# Altium schematic sheet Processing_Section.SchDoc
size A4; DocumentNumber: 3; SheetNumber: 3; SheetTotal: 5
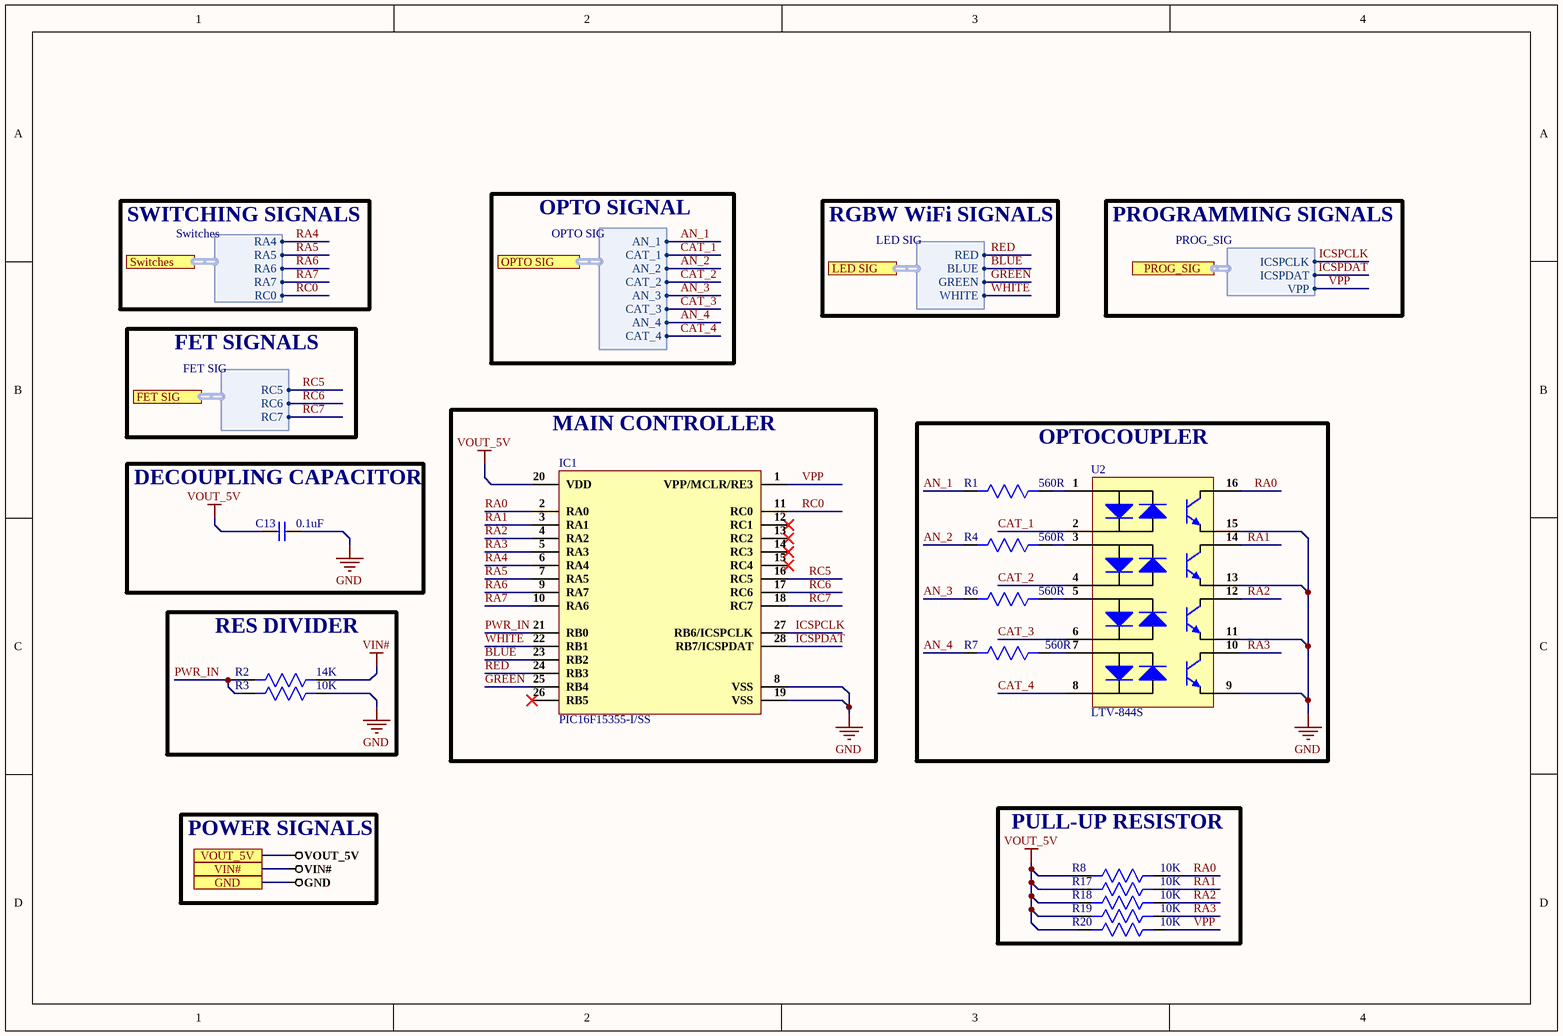
[diagram p0: Processing_Section.SchDoc]

## Parts
C13  0.1uF  [CAP 0201]
IC1  PIC16F15355-I/SS  [PIC16F15355-I/SS]
R1  560R  [RES 1210]
R2  14K  [Res0603]
R3  10K  [RES 0805]
R4  560R  [RES 1210]
R6  560R  [RES 1210]
R7  560R  [RES 1210]
R8  10K  [RES 0805]
R17  10K  [RES 0805]
R18  10K  [RES 0805]
R19  10K  [RES 0805]
R20  10K  [RES 0805]
U2  LTV-844S  [LTV-844S]

## Blocks framed on the sheet
MAIN CONTROLLER: IC1
OPTOCOUPLER: R1 R4 R6 R7 U2
DECOUPLING CAPACITOR: C13
RES DIVIDER: R2 R3
PULL-UP RESISTOR: R8 R17-R20

## Ports
FET SIG (harness FET SIG), GND, LED SIG (harness LED SIG), OPTO SIG (harness OPTO SIG), PROG_SIG (harness PROG_SIG), Switches (harness Switches), VIN#, VOUT_5V

## Harnesses
LED SIG: RED, BLUE, GREEN, WHITE
PROG_SIG: ICSPCLK, ICSPDAT, VPP
OPTO SIG: AN_1, CAT_1, AN_2, AN_3, AN_4, CAT_2, CAT_3, CAT_4
Switches: RA4, RA5, RA6, RA7, RC0
FET SIG: RC5, RC6, RC7

## Nets
GND: C13.2 IC1.8(VSS) IC1.19(VSS) R3.2 U2.9(E) U2.11(E) U2.13(E) U2.15(E) ; port GND
VIN#: R2.2 ; port VIN#
VOUT_5V: C13.1 IC1.20(VDD) R8.1 R17.1 R18.1 R19.1 R20.1 ; port VOUT_5V
AN_1: R1.1 ; port OPTO SIG.AN_1
AN_2: R4.1 ; port OPTO SIG.AN_2
AN_3: R6.1 ; port OPTO SIG.AN_3
AN_4: R7.1 ; port OPTO SIG.AN_4
BLUE: IC1.23(RB2) ; port LED SIG.BLUE
CAT_1: U2.2(K,A) ; port OPTO SIG.CAT_1
CAT_2: U2.4(K,A) ; port OPTO SIG.CAT_2
CAT_3: U2.6(K,A) ; port OPTO SIG.CAT_3
CAT_4: U2.8(K,A) ; port OPTO SIG.CAT_4
GREEN: IC1.25(RB4) ; port LED SIG.GREEN
ICSPCLK: IC1.27(RB6/ICSPCLK) ; port PROG_SIG.ICSPCLK
ICSPDAT: IC1.28(RB7/ICSPDAT) ; port PROG_SIG.ICSPDAT
PWR_IN: IC1.21(RB0) R2.1 R3.1
RA0: IC1.2(RA0) R8.2 U2.16(C)
RA1: IC1.3(RA1) R17.2 U2.14(C)
RA2: IC1.4(RA2) R18.2 U2.12(C)
RA3: IC1.5(RA3) R19.2 U2.10(C)
RA4: IC1.6(RA4) ; port Switches.RA4
RA5: IC1.7(RA5) ; port Switches.RA5
RA6: IC1.9(RA7) ; port Switches.RA6
RA7: IC1.10(RA6) ; port Switches.RA7
RC0: IC1.11(RC0) ; port Switches.RC0
RC5: IC1.16(RC5) ; port FET SIG.RC5
RC6: IC1.17(RC6) ; port FET SIG.RC6
RC7: IC1.18(RC7) ; port FET SIG.RC7
RED: IC1.24(RB3) ; port LED SIG.RED
VPP: IC1.1(VPP/MCLR/RE3) R20.2 ; port PROG_SIG.VPP
WHITE: IC1.22(RB1) ; port LED SIG.WHITE
NetR1_2: R1.2 U2.1(A,K)
NetR4_2: R4.2 U2.3(A,K)
NetR6_2: R6.2 U2.5(A,K)
NetR7_2: R7.2 U2.7(A,K)

Not connected (* = marked no-connect by the designer): IC1 12(RC1)* 13(RC2)* 14(RC3)* 15(RC4)* 26(RB5)*

## Notes on the sheet
- SWITCHING SIGNALS
- OPTO SIGNAL
- RGBW WiFi SIGNALS
- PROGRAMMING SIGNALS
- FET SIGNALS
- POWER SIGNALS

## Library data of the parts
C13 = GRM033R61E104KE14D: CAP CER 0.1UF 25V X5R 0201; Manufacturer: Murata; Capacitance: 100nF; Tolerance: 10%; Supplier 1: Mouser; Manufacturer Part Number: GRM033R61E104KE14D; RoHS: Yes; Category: Ceramic Capacitors; Stock 1: 19728; Pricing 1: 1=0.12000, 10=0.05600, 50=0.05600, 100=0.02500, 1000=0.01400, 10000=0.01100 (USD); Mount: Surface Mount; Case/Package: 0201; Case Code (Metric): 0603; Case Code (Imperial): 0201; Weight: 1.2E-05oz; Min Operating Temperature: -55°C; Max Operating Temperature: 85°C; Packaging: Tape and Reel; Voltage Rating: 25V; Dielectric: X5R; Termination: SMD/SMT; Resistor Type: Ceramic; Voltage Rating (DC): 25V; Package Quantity: 15000; Length: 0.024inch; Width: 0.012inch; Height: 0.3mm; Thickness: 0.013inch; Lead Free: Lead Free; RoHS Compliant: Yes; ComponentLink1URL: http://www.farnell.com/datasheets/2867843.pdf?src-supplier=Farnell; ComponentLink1Description: http://www.farnell.com/datasheets/2867843.pdf?src-supplier=Farnell; ComponentLink2URL: http://www.mouser.com/ds/2/281/c02e-2905.pdf?src-supplier=Mouser; ComponentLink2Description: http://www.mouser.com/ds/2/281/c02e-2905.pdf?src-supplier=Mouser; ComponentLink3URL: http://search.murata.co.jp/Ceramy/image/img/A01X/G101/ENG/GRM033R61E104KE14-01.pdf?src-supplier=Digi-Key; ComponentLink3Description: http://search.murata.co.jp/Ceramy/image/img/A01X/G101/ENG/GRM033R61E104KE14-01.pdf?src-supplier=Digi-Key; ComponentLink4URL: http://www.farnell.com/datasheets/2867843.pdf?src-supplier=Newark; ComponentLink4Description: http://www.farnell.com/datasheets/2867843.pdf?src-supplier=Newark; Supplier Part Number 1: 81-GRM033R61E104KE4D
IC1 = PIC16F15355-I/SS: IC MCU 8BIT 14KB FLASH 28SSOP; Manufacturer: Microchip; Interface: I2C,SPI,UART,USART; Peripherals: Brown-out Detect/Reset,POR,PWM,WDT; Core Architecture: PIC; Frequency: 32MHz; Number of I/Os: 25; Oscillator Type: Internal; Supplier 1: Digi-Key; Manufacturer Part Number: PIC16F15355-I/SS; RoHS: Yes; Category: Microcontrollers; Stock 1: 36; Pricing 1: 1=1.39000, 25=1.27640, 100=1.15500 (USD); Case/Package: SSOP; Min Operating Temperature: -40°C; Max Operating Temperature: 85°C; Memory Type: FLASH; Packaging: Rail/Tube; Memory Size: 14KB; RoHS Compliant: Yes; ComponentLink1URL: http://www.microchip.com/mymicrochip/filehandler.aspx?ddocname=en585524&src-supplier=Digi-Key; ComponentLink1Description: http://www.microchip.com/mymicrochip/filehandler.aspx?ddocname=en585524&src-supplier=Digi-Key; Supplier Part Number 1: PIC16F15355-I/SS-ND
R1 R4 R6 R7 = RC1210FR-07560RL: RES 560 OHM 1% 1/2W 1210; Manufacturer: Yageo; Power Rating: 500mW; Voltage Rating: 200V; Temperature Coefficient: 100ppm/°C; Supplier 1: Digi-Key; Manufacturer Part Number: RC1210FR-07560RL; RoHS: Yes; Category: Chip SMD Resistors; Pricing 1: 1=0.17000, 10=0.14900, 100=0.05740, 1000=0.02525, 2500=0.02181 (USD); Case/Package: 1210; Case Code (Imperial): 1210; Case Code (Metric): 3225; Size Code: 1210; Min Operating Temperature: -55°C; Max Operating Temperature: 155°C; Tolerance: 1%; Packaging: Tape and Reel; Resistance: 560R; Resistor Type: Thick Film; Termination: SMD/SMT; Number of Terminations: 2; Max Power Dissipation: 500mW; Features: Moisture Resistant; Series: RC; Construction: Rectangular; Length: 3.1mm; Width: 2.6mm; Height: 0.024inch; Depth: 2.6mm; Military Standard: Not; Lead Free: Lead Free; RoHS Compliant: Yes; ComponentLink1URL: https://datasheet.ciiva.com/12575/pyu-rc1210-51-rohs-l-4-12575621.pdf?src-supplier=Mouser; ComponentLink1Description: https://datasheet.ciiva.com/12575/pyu-rc1210-51-rohs-l-4-12575621.pdf?src-supplier=Mouser; Supplier Part Number 1: 13-RC1210FR-07560RLCT-ND
R2 = RT0603BRE0714KL: RES SMD 0603 14kOhm 0.1% Paper T/R; Manufacturer: Yageo; Resistance: 14kR; Power Rating: 100mW; Voltage Rating (DC): 50V; Temperature Coefficient: 50ppm/°C; Supplier 1: Digi-Key; Manufacturer Part Number: RT0603BRE0714KL; RoHS: Yes; Category: Chip SMD Resistors; Pricing 1: 5000=0.04543 (USD); Case/Package: 0603; Min Operating Temperature: -55°C; Max Operating Temperature: 155°C; Tolerance: 0.1%; Packaging: Tape and Reel; Resistor Type: Thin Film; Series: RT; Max Power Dissipation: 100mW; Number of Terminations: 2; Construction: Rectangular; Length: 1.6mm; Width: 800um; Depth: 0.8mm; Military Standard: Not; Lead Free: Lead Free; RoHS Compliant: Yes; ComponentLink1URL: http://components.arrow.com/part/dataview/0323_03292491?src-supplier=Arrow+Europe; ComponentLink1Description: http://components.arrow.com/part/dataview/0323_03292491?src-supplier=Arrow+Europe; ComponentLink2URL: http://www.yageo.com/documents/recent/PYu-RT_1-to-0.01_RoHS_L_9.pdf?src-supplier=Digi-Key; ComponentLink2Description: http://www.yageo.com/documents/recent/PYu-RT_1-to-0.01_RoHS_L_9.pdf?src-supplier=Digi-Key; Supplier Part Number 1: RT0603BRE0714KL-ND
R3 R8 R17-R20 = 0805W8F1002T5E: ±1% 1/8W Thick Film Resistors 150V ±100ppm/℃ -55℃~+155℃ 10kΩ 0805 Chip Resistor - Surface Mount ROHS; Manufacturer: UNI-ROYAL; Manufacturer Part No: 0805W8F1002T5E; Package: 0805; Value: 10kΩ
U2 = LTV-844S: OPTOISOLTR 5KV 4CH TRANS 16-SMD; Manufacturer: Vishay Lite-On; Forward Voltage: 1.4V; Number of Channels: 4; Collector Emitter Voltage (VCEO): 35V; Rise Time: 18000ns; Forward Current: 50mA; Collector Emitter Saturation Voltage: 200mV; Current Transfer Ratio: 300%; Max Power Dissipation: 200mW; Input Type: AC; Supplier 1: Future Electronics; Manufacturer Part Number: LTV-844S; RoHS: Yes; Category: Optocouplers; Stock 1: 1400; Pricing 1: 25=0.90500 (USD); Mount: Surface Mount; Case/Package: SMD/SMT; Number of Pins: 16; Min Operating Temperature: -30°C; Max Operating Temperature: 100°C; Packaging: Rail/Tube; Max Output Voltage: 35V; Output Current per Channel: 50mA; Fall Time: 18000ns; Number of Elements: 4; Power Dissipation: 200mW; Isolation Voltage: 5kV; Max Input Current: 50mA; Max Collector Current: 50mA; Package Quantity: 25; Series: -; Collector-emitter Voltage-Max: 200mV; Number of Circuits: 4; Output Voltage: 35V; Isolation Voltage-Max: 5kV; Radiation Hardening: No; RoHS Compliant: Yes; Lead Free: Lead Free; ComponentLink1URL: https://datasheet.ciiva.com/11772/0900766b80de6b5f-11772471.pdf?src-supplier=RSComponents; ComponentLink1Description: https://datasheet.ciiva.com/11772/0900766b80de6b5f-11772471.pdf?src-supplier=RSComponents; ComponentLink2URL: https://datasheet.ciiva.com/15118/getdatasheetpartid-141775-15118788.pdf?src-supplier=Verical; ComponentLink2Description: https://datasheet.ciiva.com/15118/getdatasheetpartid-141775-15118788.pdf?src-supplier=Verical; ComponentLink3URL: https://datasheet.ciiva.com/2086/s-110-ltv-814824844m-s-s-ta-s-ta1-s-tpseries-2086434.pdf?src-supplier=Digi-Key; ComponentLink3Description: https://datasheet.ciiva.com/2086/s-110-ltv-814824844m-s-s-ta-s-ta1-s-tpseries-2086434.pdf?src-supplier=Digi-Key; ComponentLink4URL: https://datasheet.ciiva.com/15957/ltv-8x4-15957686.pdf?src-supplier=Onlinecomponents.com; ComponentLink4Description: https://datasheet.ciiva.com/15957/ltv-8x4-15957686.pdf?src-supplier=Onlinecomponents.com; ComponentLink5URL: https://datasheet.ciiva.com/26923/getdatasheetpartid-757770-26923467.pdf?src-supplier=Verical; ComponentLink5Description: https://datasheet.ciiva.com/26923/getdatasheetpartid-757770-26923467.pdf?src-supplier=Verical; Supplier Part Number 1: 5600457